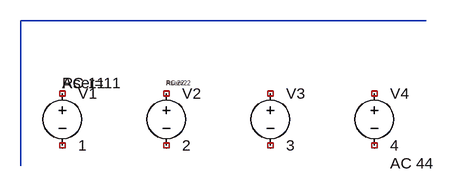
[diagram p0: schematic value2_at_origin.asc]
value2_at_origin.asc, the LTspice schematic file:
Version 4
SHEET 1 720 280
WIRE -32 -64 592 -64
WIRE -32 -64 -32 160
SYMBOL voltage 32 32 R0
WINDOW 123 0 0 Left 2
WINDOW 39 0 0 Left 2
SYMATTR InstName V1
SYMATTR Value 1
SYMATTR Value2 AC 11
SYMATTR SpiceLine Rser=11
SYMBOL voltage 192 32 R0
WINDOW 123 0 0 Left 0
WINDOW 39 0 0 Left 0
SYMATTR InstName V2
SYMATTR Value 2
SYMATTR Value2 AC 22
SYMATTR SpiceLine Rser=22
SYMBOL voltage 352 32 R0
WINDOW 123 0 0 Left 2
WINDOW 39 0 0 Left 2
SYMATTR InstName V3
SYMATTR Value 3
SYMATTR Value2 ""
SYMATTR SpiceLine ""
SYMBOL voltage 512 32 R0
WINDOW 123 24 124 Left 2
SYMATTR InstName V4
SYMATTR Value 4
SYMATTR Value2 AC 44

The netlist it stands for:
* value2_at_origin.asc
V1 NC_01 NC_02 1 AC 11 Rser=11
V2 NC_03 NC_04 2 AC 22 Rser=22
V3 NC_05 NC_06 3
V4 NC_07 NC_08 4 AC 44
.backanno
.end